# Altium schematic sheet Load1.SchDoc
size A4; SheetNumber: 4; SheetTotal: 15
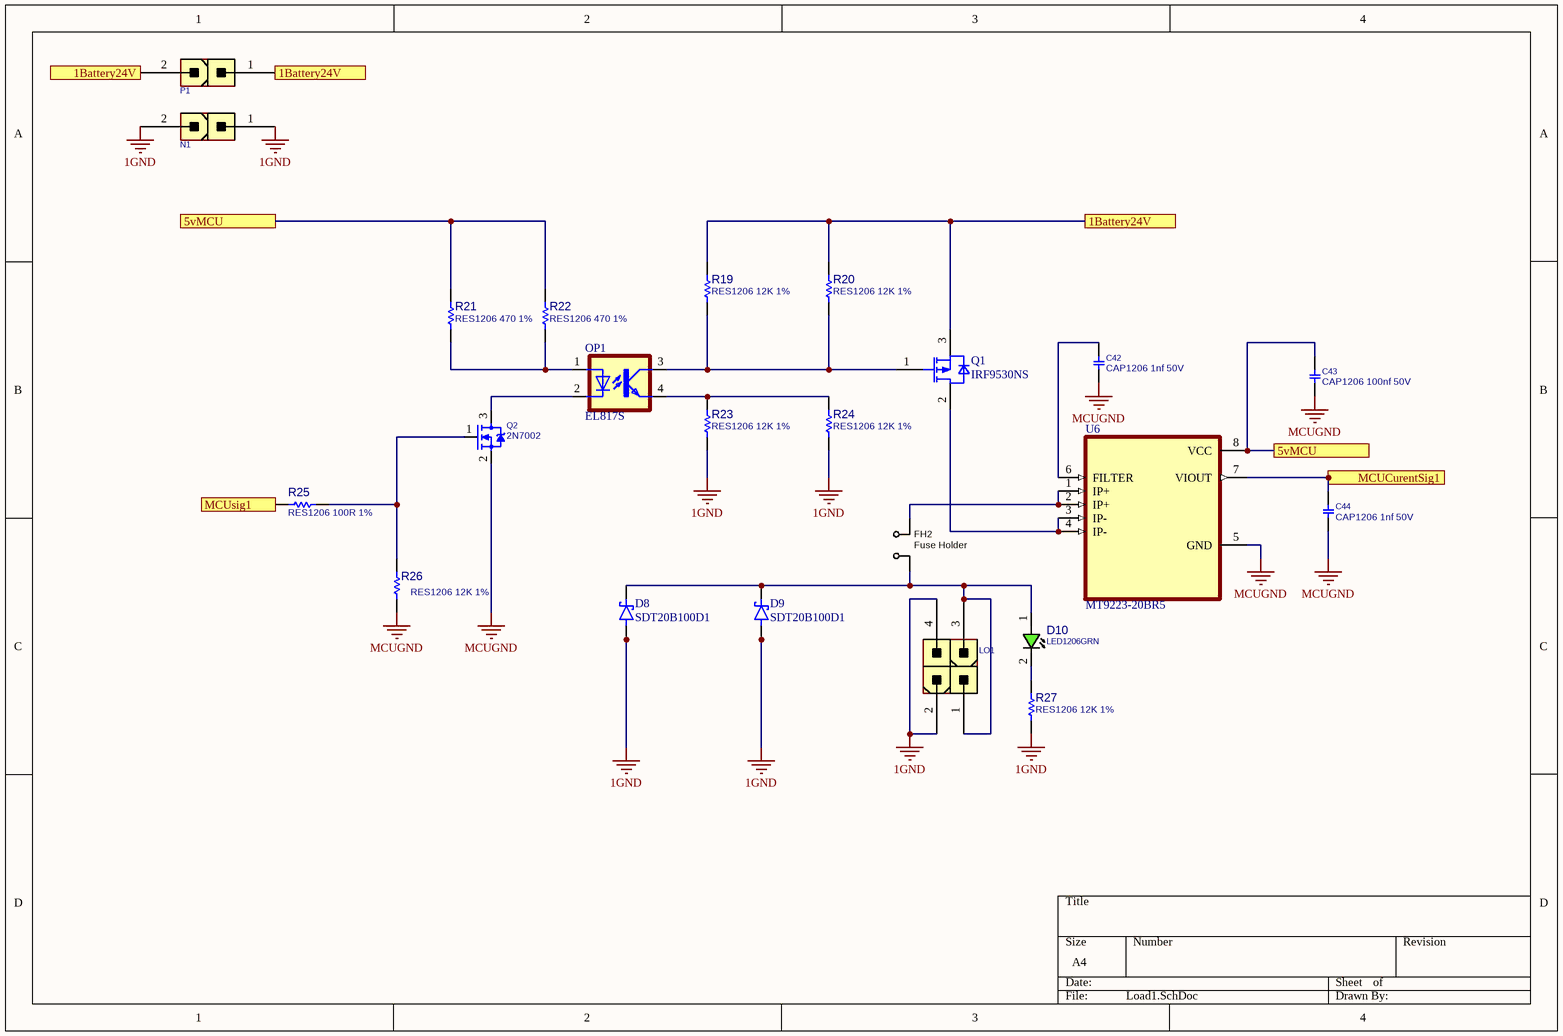
[diagram p0: Load1.SchDoc]

## Parts
C42  CAP1206 1nf 50V  [C1206]
C43  CAP1206 100nf 50V  [C1206]
C44  CAP1206 1nf 50V  [C1206]
D8  SDT20B100D1  [DPAK229P990X238-3N]
D9  SDT20B100D1  [DPAK229P990X238-3N]
D10  LED1206GRN  [LED1206GRN]
FH2  Fuse Holder  [FH_24101812]
LO1  CONN_ATXPWR_4  [ATXPWR_4]  (value not drawn)
N1  CONN_ATXPWR_2  [ATXPWR_2]  (value not drawn)
OP1  EL817S  [SOIC254P1030X460-4N]
P1  CONN_ATXPWR_2  [ATXPWR_2]  (value not drawn)
Q1  IRF9530NS  [TO254P1528X508-4_3N-V1]
Q2  2N7002  [SOT23_3]
R19  RES1206 12K 1%  [R1206]
R20  RES1206 12K 1%  [R1206]
R21  RES1206 470 1%  [R1206]
R22  RES1206 470 1%  [R1206]
R23  RES1206 12K 1%  [R1206]
R24  RES1206 12K 1%  [R1206]
R25  RES1206 100R 1%  [R1206]
R26  RES1206 12K 1%  [R1206]
R27  RES1206 12K 1%  [R1206]
U6  MT9223-20BR5  [SOIC127P600X175-8N]

## Ports
1Battery24V, 5vMCU, MCUCurentSig1, MCUsig1

## Nets
1GND: D8.1(A) D8.3(A__1) D9.1(A) D9.3(A__1) LO1.2 LO1.4 N1.1 N1.2 R23.2 R24.2 R27.2
MCUGND: C42.2 C43.2 C44.2 Q2.2(SOURCE) R26.2 U6.5(GND)
1Battery24V: P1.1 P1.2 Q1.3(SOURCE) R19.1 R20.1 ; port 1Battery24V
5vMCU: C43.1 R21.2 R22.2 U6.8(VCC) ; port 5vMCU
MCUCurentSig1: C44.1 U6.7(VIOUT) ; port MCUCurentSig1
MCUsig1: R25.1 ; port MCUsig1
NetC42_1: C42.1 U6.6(FILTER)
NetD8_4: D8.4(K) D9.4(K) D10.1(ANODE) FH2.1 LO1.1 LO1.3
NetD10_2: D10.2(CATHODE) R27.1
NetFH2_2: FH2.2 U6.1(IP+) U6.2(IP+)
NetOP1_1: OP1.1(A) R21.1 R22.1
NetOP1_2: OP1.2(C) Q2.3(DRAIN)
NetOP1_3: OP1.3(COL) Q1.1(GATE) R19.2 R20.2
NetOP1_4: OP1.4(EMIT) R23.1 R24.1
NetQ1_2: Q1.2(DRAIN) U6.3(IP-) U6.4(IP-)
NetQ2_1: Q2.1(GATE) R25.2 R26.1

## Library data of the parts
C42-C44 = CAP_SMD_MLCC_1206: CAP, MLCC; PARAM: -, -%; MANF_P#: MANF_PART#; PARAM2: -V; PRICE: 100= 1$; MANF: -; ASSEMBLY: ASSEMBLY
D8 D9 = MBRD835L: Diode Schottky 35 V 8A Surface Mount DPAK; MF: ON Semiconductor; SnapEDA_Link: https://www.snapeda.com/parts/MBRD835L/Onsemi/view-part/?ref=snap; Package: TO-252-3 MICROSS/On Semiconductor; Value: *; MP: MBRD835L; Check_prices: https://www.snapeda.com/parts/MBRD835L/Onsemi/view-part/?ref=eda
D10 = LED_SMD_1206_GRN: LED, SMD, 1206, GREEN; PARAM: 20mA; DESC: DESCRIPTION; PARAM2: 2.2V; MANF: -; ASSEMBLY: ASSEMBLY; PRICE: 36t@Javan; MANF_P#: -; VALUE: LED1206GRN; MountType: SMT; PartType: LED
FH2 = FUSE_SMD_HOLDER_24101812: Fuse SMD2410 Holder; PARAM: max. 10A; MANF: Littelfuse; MANF_P#: 01550900M; PARAM2: 125v; PRICE: 0.2$; PACKAGE: SMD,5.0x9.7mm; VALUE: Fuse Holder
LO1 = CONN_ATXPWR_4: CONN, ATX POWER, 4 P; MANF: TE, Molex; MANF_P#: 4-1775099-0, 39281043; VALUE: CONN_ATXPWR_4; MountType: THD; PACKAGE: ATXPWR-4pin; Part Type: Conn.
N1 P1 = CONN_ATXPWR_2: CONN, ATX POWER, 2 P; MANF: Molex; MANF_P#: 39281023; VALUE: CONN_ATXPWR_2; MountType: THD; PACKAGE: ATXPWR-2pin; Part Type: Conn.
OP1 = EL817S: Optoisolator Transistor Output 5000Vrms 1 Channel 4-SMD; MF: Everlight Electronics; SnapEDA_Link: https://www.snapeda.com/parts/EL817S/Everlight+Electronics+Co+Ltd/view-part/?ref=snap; Package: SMD-4 Everlight Electronics Co Ltd; Value: *; MP: EL817S; Check_prices: https://www.snapeda.com/parts/EL817S/Everlight+Electronics+Co+Ltd/view-part/?ref=eda
Q1 = IRF9530NS: OptiMOS - P2 Power-Transistor, P-channel-Enhancement mode, VDS -30V; Manufacturer: Infineon Technologies; Manufacturer Order NumberManufacturer Order Number: IRF9530NS; PackageReference: PG-TO263-3-901
Q2 = MOSN_2N7002_SOT23: MOSFET, N-CH, 60V, 0.3A; MANF: NXP; ASSEMBLY: ASSEMBLY; MANF_P#: 2N7002; PARAM2: 60v; PARAM: 0.3A; PRICE: 0.3t@Javan; VALUE: 2N7002
R19-R27 = RES_SMD_1206: RESISTOR, SMD; PARAM: 1%, 0.25W; DESC: DESCRIPTION; DIST#: MOUSER; MANF_P#: -; MANF: -; ASSEMBLY: ASSEMBLY; PRICE: -; PARAM2: -
U6 = ACS712ELCTR-05B-T: MF: {'manufacturer': u'Allegro MicroSystems'}; Package: None; Price: None; Value: *; MP: ACS712ELCTR-05B-T; Availability: Unavailable